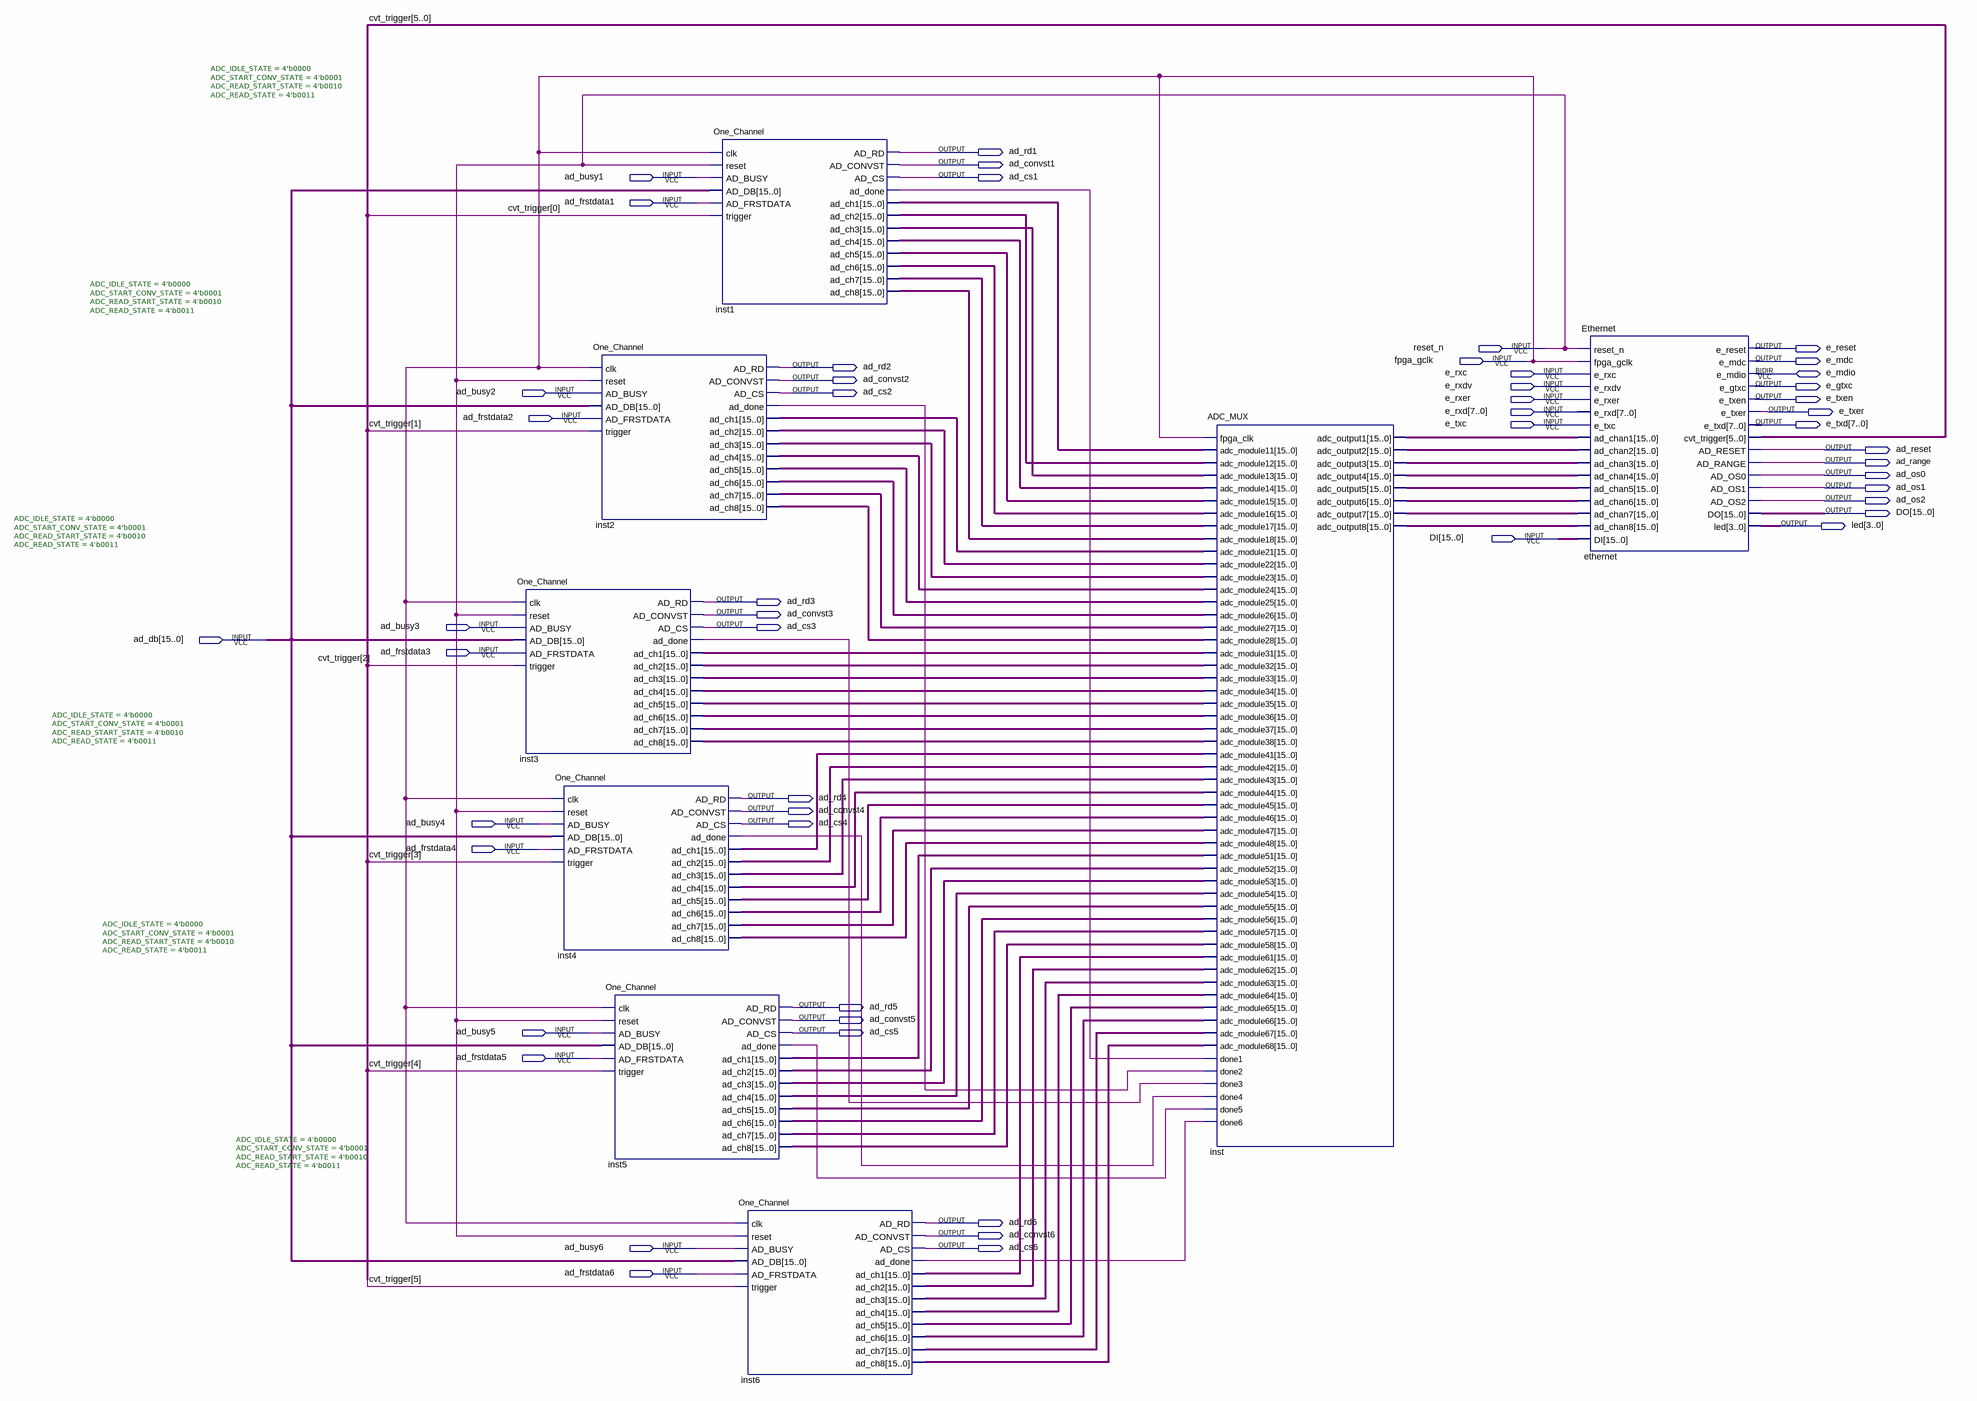
[diagram p0: schematic sheet]
// Quartus schematic MultipleADC.bdf as structural Verilog: 8 symbols, 53 pins
module MultipleADC (
  input  ad_busy1,
  input  ad_frstdata1,
  input  reset_n,
  input  fpga_gclk,
  input  e_rxc,
  input  e_rxdv,
  input  ad_busy2,
  input  e_rxer,
  input  [7:0] e_rxd,
  input  ad_frstdata2,
  input  e_txc,
  input  [15:0] DI,
  input  ad_busy3,
  input  [15:0] ad_db,
  input  ad_frstdata3,
  input  ad_busy4,
  input  ad_frstdata4,
  input  ad_busy5,
  input  ad_frstdata5,
  input  ad_busy6,
  input  ad_frstdata6,
  inout  e_mdio,
  output ad_rd1,
  output ad_convst1,
  output ad_cs1,
  output e_reset,
  output e_mdc,
  output ad_rd2,
  output ad_convst2,
  output e_gtxc,
  output ad_cs2,
  output e_txen,
  output e_txer,
  output [7:0] e_txd,
  output ad_reset,
  output ad_range,
  output ad_os0,
  output ad_os1,
  output ad_os2,
  output [15:0] DO,
  output [3:0] led,
  output ad_rd3,
  output ad_convst3,
  output ad_cs3,
  output ad_rd4,
  output ad_convst4,
  output ad_cs4,
  output ad_rd5,
  output ad_convst5,
  output ad_cs5,
  output ad_rd6,
  output ad_convst6,
  output ad_cs6
);

  wire inst1_ad_done, inst2_ad_done, inst3_ad_done, inst4_ad_done, inst5_ad_done, inst6_ad_done;
  wire [5:0] cvt_trigger;
  wire [15:0] inst1_ad_ch1, inst1_ad_ch2, inst1_ad_ch3, inst1_ad_ch4, inst1_ad_ch5, inst1_ad_ch6,
       inst1_ad_ch7, inst1_ad_ch8, inst2_ad_ch1, inst2_ad_ch2, inst2_ad_ch3, inst2_ad_ch4, inst2_ad_ch5,
       inst2_ad_ch6, inst2_ad_ch7, inst2_ad_ch8, inst3_ad_ch1, inst3_ad_ch2, inst3_ad_ch3, inst3_ad_ch4,
       inst3_ad_ch5, inst3_ad_ch6, inst3_ad_ch7, inst3_ad_ch8, inst4_ad_ch1, inst4_ad_ch2, inst4_ad_ch3,
       inst4_ad_ch4, inst4_ad_ch5, inst4_ad_ch6, inst4_ad_ch7, inst4_ad_ch8, inst5_ad_ch1, inst5_ad_ch2,
       inst5_ad_ch3, inst5_ad_ch4, inst5_ad_ch5, inst5_ad_ch6, inst5_ad_ch7, inst5_ad_ch8, inst6_ad_ch1,
       inst6_ad_ch2, inst6_ad_ch3, inst6_ad_ch4, inst6_ad_ch5, inst6_ad_ch6, inst6_ad_ch7, inst6_ad_ch8,
       inst_adc_output1, inst_adc_output2, inst_adc_output3, inst_adc_output4, inst_adc_output5,
       inst_adc_output6, inst_adc_output7, inst_adc_output8;

  One_Channel #(.ADC_IDLE_STATE(4'b0000), .ADC_START_CONV_STATE(4'b0001), .ADC_READ_START_STATE(4'b0010), .ADC_READ_STATE(4'b0011)) inst3 (
    .clk(fpga_gclk), .reset(reset_n), .AD_BUSY(ad_busy3), .AD_DB(ad_db), .AD_FRSTDATA(ad_frstdata3),
    .trigger(cvt_trigger[2]), .AD_RD(ad_rd3), .AD_CONVST(ad_convst3), .AD_CS(ad_cs3),
    .ad_done(inst3_ad_done), .ad_ch1(inst3_ad_ch1), .ad_ch2(inst3_ad_ch2), .ad_ch3(inst3_ad_ch3),
    .ad_ch4(inst3_ad_ch4), .ad_ch5(inst3_ad_ch5), .ad_ch6(inst3_ad_ch6), .ad_ch7(inst3_ad_ch7),
    .ad_ch8(inst3_ad_ch8));
  One_Channel #(.ADC_IDLE_STATE(4'b0000), .ADC_START_CONV_STATE(4'b0001), .ADC_READ_START_STATE(4'b0010), .ADC_READ_STATE(4'b0011)) inst4 (
    .clk(fpga_gclk), .reset(reset_n), .AD_BUSY(ad_busy4), .AD_DB(ad_db), .AD_FRSTDATA(ad_frstdata4),
    .trigger(cvt_trigger[3]), .AD_RD(ad_rd4), .AD_CONVST(ad_convst4), .AD_CS(ad_cs4),
    .ad_done(inst4_ad_done), .ad_ch1(inst4_ad_ch1), .ad_ch2(inst4_ad_ch2), .ad_ch3(inst4_ad_ch3),
    .ad_ch4(inst4_ad_ch4), .ad_ch5(inst4_ad_ch5), .ad_ch6(inst4_ad_ch6), .ad_ch7(inst4_ad_ch7),
    .ad_ch8(inst4_ad_ch8));
  One_Channel #(.ADC_IDLE_STATE(4'b0000), .ADC_START_CONV_STATE(4'b0001), .ADC_READ_START_STATE(4'b0010), .ADC_READ_STATE(4'b0011)) inst2 (
    .clk(fpga_gclk), .reset(reset_n), .AD_BUSY(ad_busy2), .AD_DB(ad_db), .trigger(cvt_trigger[1]),
    .AD_RD(ad_rd2), .AD_CONVST(ad_convst2), .AD_CS(ad_cs2), .ad_done(inst2_ad_done), .ad_ch1(inst2_ad_ch1),
    .ad_ch2(inst2_ad_ch2), .ad_ch3(inst2_ad_ch3), .ad_ch4(inst2_ad_ch4), .ad_ch5(inst2_ad_ch5),
    .ad_ch6(inst2_ad_ch6), .ad_ch7(inst2_ad_ch7), .ad_ch8(inst2_ad_ch8));  // open: AD_FRSTDATA
  One_Channel #(.ADC_IDLE_STATE(4'b0000), .ADC_START_CONV_STATE(4'b0001), .ADC_READ_START_STATE(4'b0010), .ADC_READ_STATE(4'b0011)) inst5 (
    .clk(fpga_gclk), .reset(reset_n), .AD_BUSY(ad_busy5), .AD_DB(ad_db), .AD_FRSTDATA(ad_frstdata5),
    .trigger(cvt_trigger[4]), .AD_RD(ad_rd5), .AD_CONVST(ad_convst5), .AD_CS(ad_cs5),
    .ad_done(inst5_ad_done), .ad_ch1(inst5_ad_ch1), .ad_ch2(inst5_ad_ch2), .ad_ch3(inst5_ad_ch3),
    .ad_ch4(inst5_ad_ch4), .ad_ch5(inst5_ad_ch5), .ad_ch6(inst5_ad_ch6), .ad_ch7(inst5_ad_ch7),
    .ad_ch8(inst5_ad_ch8));
  One_Channel #(.ADC_IDLE_STATE(4'b0000), .ADC_START_CONV_STATE(4'b0001), .ADC_READ_START_STATE(4'b0010), .ADC_READ_STATE(4'b0011)) inst1 (
    .clk(fpga_gclk), .reset(reset_n), .AD_BUSY(ad_busy1), .AD_DB(ad_db), .AD_FRSTDATA(ad_frstdata1),
    .trigger(cvt_trigger[0]), .AD_RD(ad_rd1), .AD_CONVST(ad_convst1), .AD_CS(ad_cs1),
    .ad_done(inst1_ad_done), .ad_ch1(inst1_ad_ch1), .ad_ch2(inst1_ad_ch2), .ad_ch3(inst1_ad_ch3),
    .ad_ch4(inst1_ad_ch4), .ad_ch5(inst1_ad_ch5), .ad_ch6(inst1_ad_ch6), .ad_ch7(inst1_ad_ch7),
    .ad_ch8(inst1_ad_ch8));
  One_Channel #(.ADC_IDLE_STATE(4'b0000), .ADC_START_CONV_STATE(4'b0001), .ADC_READ_START_STATE(4'b0010), .ADC_READ_STATE(4'b0011)) inst6 (
    .clk(fpga_gclk), .reset(reset_n), .AD_BUSY(ad_busy6), .AD_DB(ad_db), .AD_FRSTDATA(ad_frstdata6),
    .trigger(cvt_trigger[5]), .AD_RD(ad_rd6), .AD_CONVST(ad_convst6), .AD_CS(ad_cs6),
    .ad_done(inst6_ad_done), .ad_ch1(inst6_ad_ch1), .ad_ch2(inst6_ad_ch2), .ad_ch3(inst6_ad_ch3),
    .ad_ch4(inst6_ad_ch4), .ad_ch5(inst6_ad_ch5), .ad_ch6(inst6_ad_ch6), .ad_ch7(inst6_ad_ch7),
    .ad_ch8(inst6_ad_ch8));
  ADC_MUX inst (
    .fpga_clk(fpga_gclk), .adc_module11(inst1_ad_ch1), .adc_module12(inst1_ad_ch2),
    .adc_module13(inst1_ad_ch3), .adc_module14(inst1_ad_ch4), .adc_module15(inst1_ad_ch5),
    .adc_module16(inst1_ad_ch6), .adc_module17(inst1_ad_ch7), .adc_module18(inst1_ad_ch8),
    .adc_module21(inst2_ad_ch1), .adc_module22(inst2_ad_ch2), .adc_module23(inst2_ad_ch3),
    .adc_module24(inst2_ad_ch4), .adc_module25(inst2_ad_ch5), .adc_module26(inst2_ad_ch6),
    .adc_module27(inst2_ad_ch7), .adc_module28(inst2_ad_ch8), .adc_module31(inst3_ad_ch1),
    .adc_module32(inst3_ad_ch2), .adc_module33(inst3_ad_ch3), .adc_module34(inst3_ad_ch4),
    .adc_module35(inst3_ad_ch5), .adc_module36(inst3_ad_ch6), .adc_module37(inst3_ad_ch7),
    .adc_module38(inst3_ad_ch8), .adc_module41(inst4_ad_ch1), .adc_module42(inst4_ad_ch2),
    .adc_module43(inst4_ad_ch3), .adc_module44(inst4_ad_ch4), .adc_module45(inst4_ad_ch5),
    .adc_module46(inst4_ad_ch6), .adc_module47(inst4_ad_ch7), .adc_module48(inst4_ad_ch8),
    .adc_module51(inst5_ad_ch1), .adc_module52(inst5_ad_ch2), .adc_module53(inst5_ad_ch3),
    .adc_module54(inst5_ad_ch4), .adc_module55(inst5_ad_ch5), .adc_module56(inst5_ad_ch6),
    .adc_module57(inst5_ad_ch7), .adc_module58(inst5_ad_ch8), .adc_module61(inst6_ad_ch1),
    .adc_module62(inst6_ad_ch2), .adc_module63(inst6_ad_ch3), .adc_module64(inst6_ad_ch4),
    .adc_module65(inst6_ad_ch5), .adc_module66(inst6_ad_ch6), .adc_module67(inst6_ad_ch7),
    .adc_module68(inst6_ad_ch8), .done1(inst1_ad_done), .done2(inst2_ad_done), .done3(inst3_ad_done),
    .done4(inst4_ad_done), .done5(inst5_ad_done), .done6(inst6_ad_done), .adc_output1(inst_adc_output1),
    .adc_output2(inst_adc_output2), .adc_output3(inst_adc_output3), .adc_output4(inst_adc_output4),
    .adc_output5(inst_adc_output5), .adc_output6(inst_adc_output6), .adc_output7(inst_adc_output7),
    .adc_output8(inst_adc_output8));
  Ethernet ethernet (
    .reset_n(reset_n), .fpga_gclk(fpga_gclk), .e_rxc(e_rxc), .e_rxdv(e_rxdv), .e_rxer(e_rxer), .e_rxd(e_rxd),
    .e_txc(e_txc), .ad_chan1(inst_adc_output1), .ad_chan2(inst_adc_output2), .ad_chan3(inst_adc_output3),
    .ad_chan4(inst_adc_output4), .ad_chan5(inst_adc_output5), .ad_chan6(inst_adc_output6),
    .ad_chan7(inst_adc_output7), .ad_chan8(inst_adc_output8), .DI(DI), .e_reset(e_reset), .e_mdc(e_mdc),
    .e_gtxc(e_gtxc), .e_txen(e_txen), .e_txer(e_txer), .e_txd(e_txd), .cvt_trigger(cvt_trigger),
    .AD_RESET(ad_reset), .AD_RANGE(ad_range), .AD_OS0(ad_os0), .AD_OS1(ad_os1), .AD_OS2(ad_os2), .DO(DO),
    .led(led), .e_mdio(e_mdio));
endmodule
